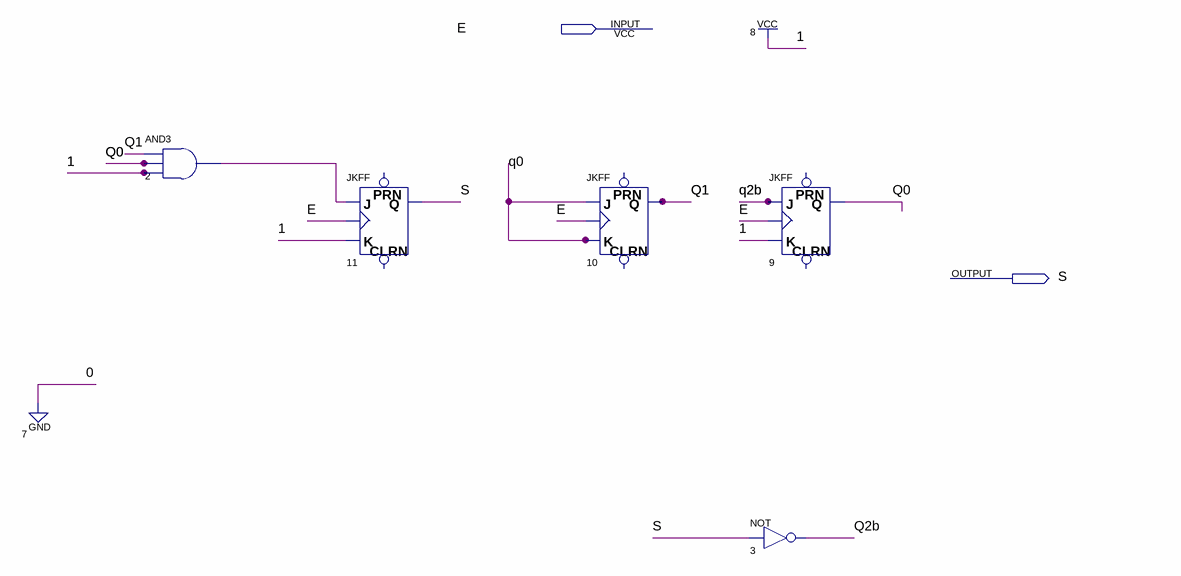
[diagram p0: schematic sheet]
// Quartus schematic div5.bdf as structural Verilog: 5 symbols, 2 pins
module div5 (
  input  E,
  output S
);

  wire n2_out, Q0, Q1, Q2b;

  and u_2 (n2_out, Q1, Q0, 1'b1);
  JKFF u_11 (.K(1'b1), .J(n2_out), .CLK(E), .Q(S));  // open: PRN, CLRN
  JKFF u_10 (.K(Q0), .J(Q0), .CLK(E), .Q(Q1));  // open: PRN, CLRN
  JKFF u_9 (.K(1'b1), .J(Q2b), .CLK(E), .Q(Q0));  // open: PRN, CLRN
  not u_3 (Q2b, S);
endmodule
